# EAGLE schematic Teensy_Mother_Schematic (EAGLE 9.7.0)
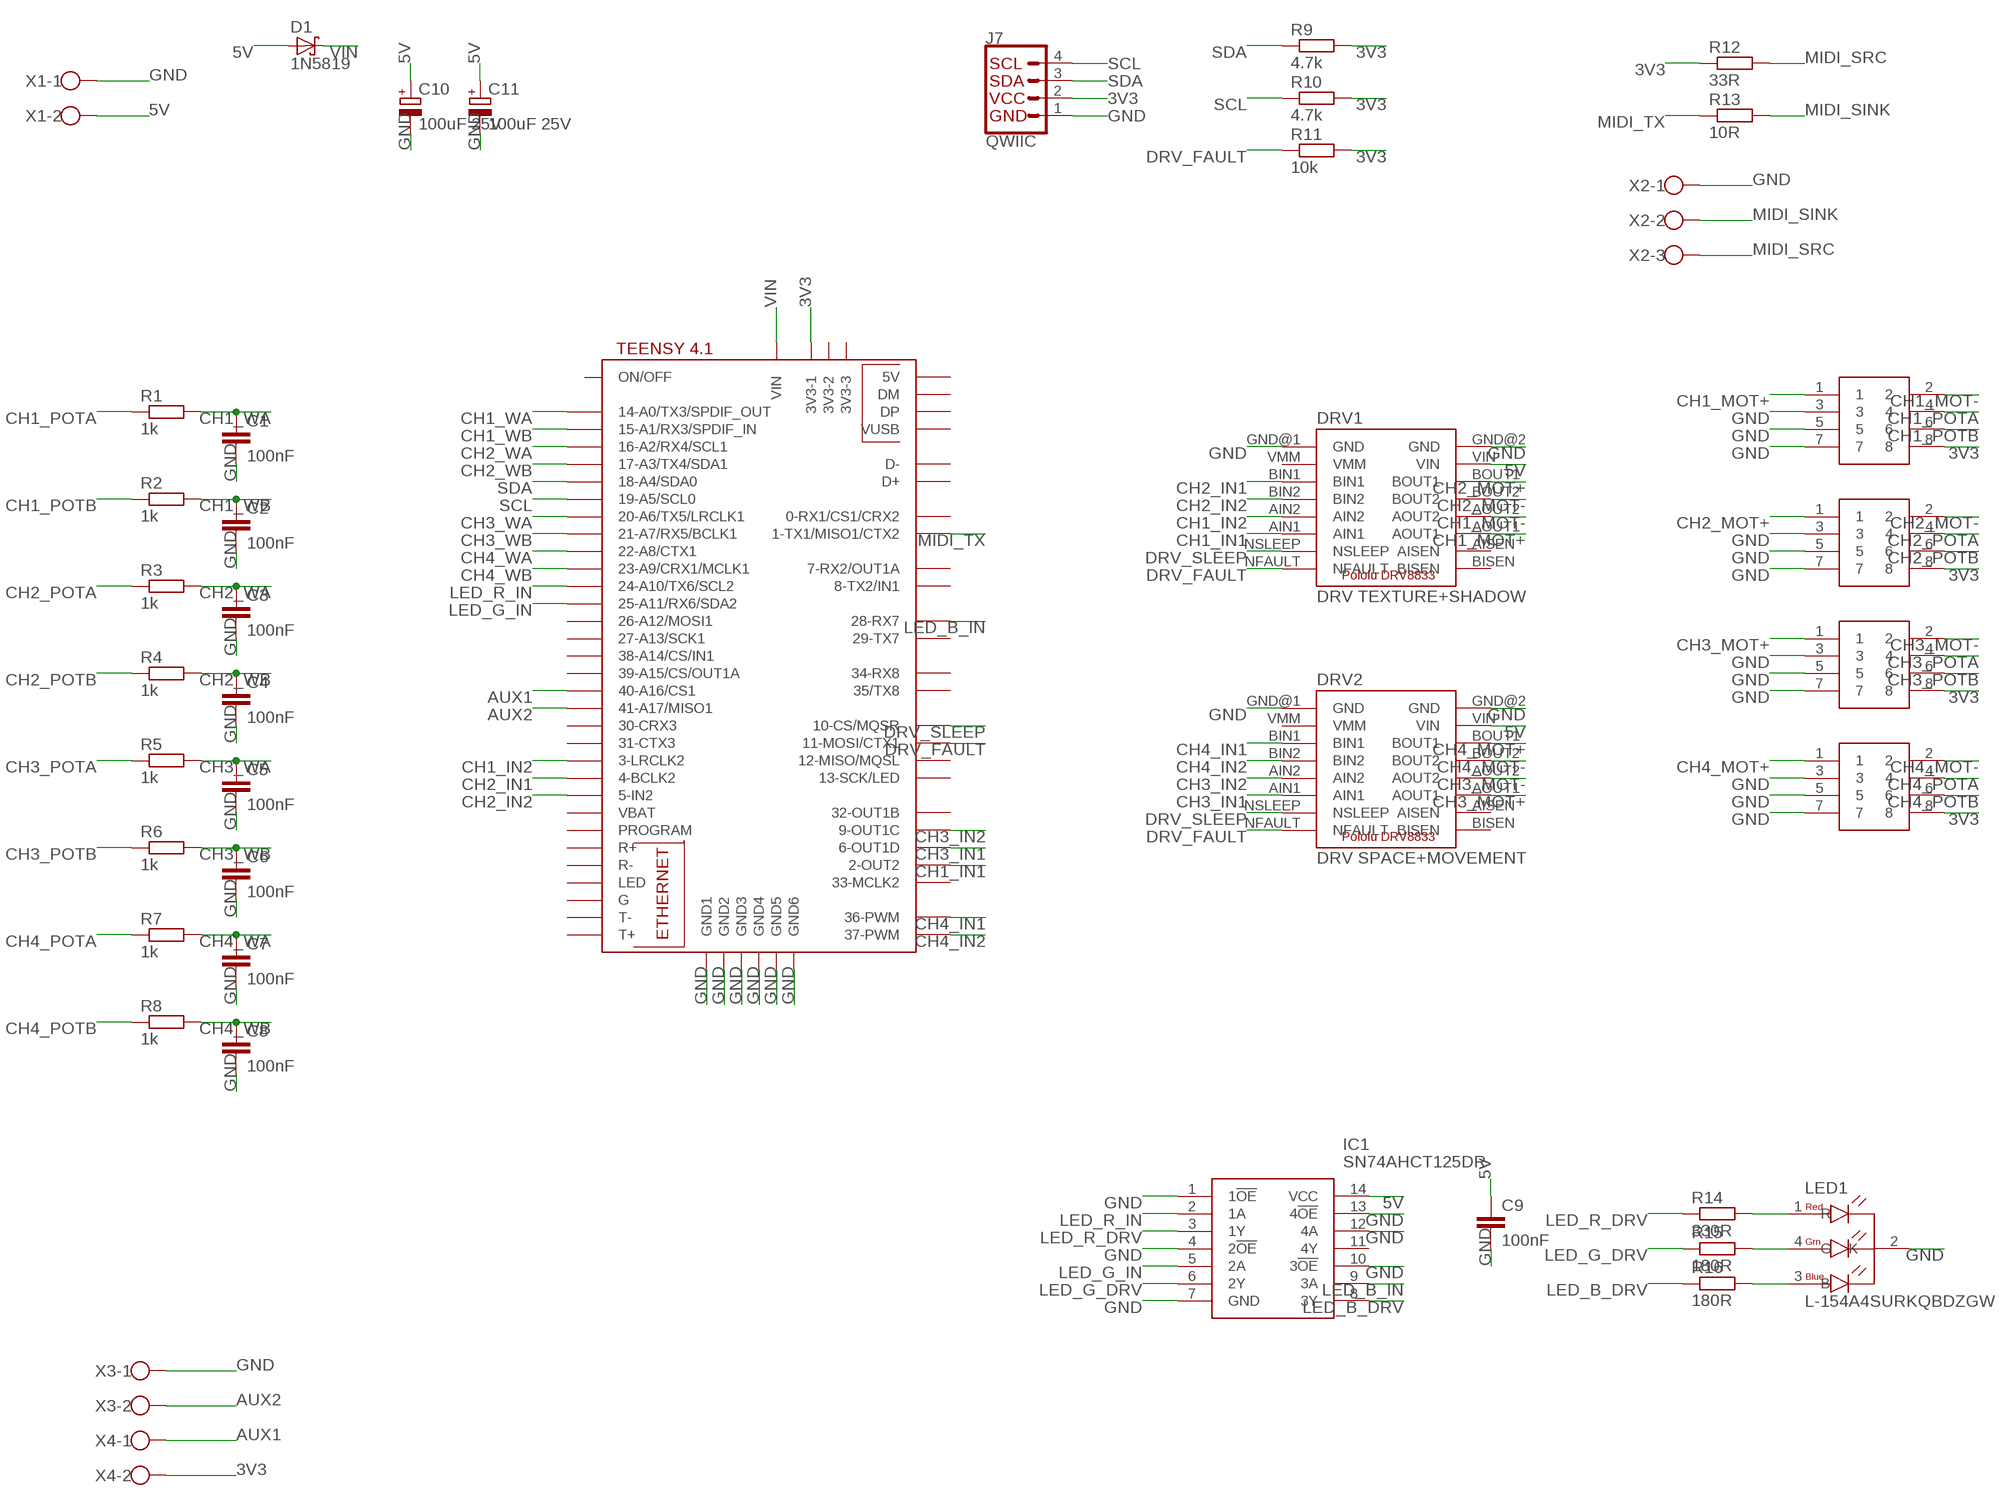
[diagram p0: schematic, sheet 1]

## Parts
C1  100nF  C-EU050-025X075  [C050-025X075]
C2  100nF  C-EU050-025X075  [C050-025X075]
C3  100nF  C-EU050-025X075  [C050-025X075]
C4  100nF  C-EU050-025X075  [C050-025X075]
C5  100nF  C-EU050-025X075  [C050-025X075]
C6  100nF  C-EU050-025X075  [C050-025X075]
C7  100nF  C-EU050-025X075  [C050-025X075]
C8  100nF  C-EU050-025X075  [C050-025X075]
C9  100nF  C-EU050-025X075  [C050-025X075]
C10  100uF 25V  CPOL-EUE3.5-8  [E3,5-8]
C11  100uF 25V  CPOL-EUE3.5-8  [E3,5-8]
D1  1N5819  SCHOTTKY-DIODEDO41  [DO41-10]
DRV1  DRV TEXTURE+SHADOW  POLOLU_DRV8833_2130  [POLOLU_2130_FH]
DRV2  DRV SPACE+MOVEMENT  POLOLU_DRV8833_2130  [POLOLU_2130_FH]
IC1  SN74AHCT125DR  [SOIC127P600X175-14N]
J1  SHADOW  IDC_2X4  [BOXHDR_2X4_V]
J2  TEXTURE  IDC_2X4  [BOXHDR_2X4_V]
J3  MOVEMENT  IDC_2X4  [BOXHDR_2X4_V]
J4  SPACE  IDC_2X4  [BOXHDR_2X4_V]
J7  QWIIC  I2C_STANDARD  [1X04]
LED1  L-154A4SURKQBDZGW  [LED5MM_RGB_4L_STAGGER]
R1  1k  R-EU_0204/7  [0204/7]
R2  1k  R-EU_0204/7  [0204/7]
R3  1k  R-EU_0204/7  [0204/7]
R4  1k  R-EU_0204/7  [0204/7]
R5  1k  R-EU_0204/7  [0204/7]
R6  1k  R-EU_0204/7  [0204/7]
R7  1k  R-EU_0204/7  [0204/7]
R8  1k  R-EU_0204/7  [0204/7]
R9  4.7k  R-EU_0204/7  [0204/7]
R10  4.7k  R-EU_0204/7  [0204/7]
R11  10k  R-EU_0204/7  [0204/7]
R12  33R  R-EU_0204/7  [0204/7]
R13  10R  R-EU_0204/7  [0204/7]
R14  330R  R-EU_0204/7  [0204/7]
R15  180R  R-EU_0204/7  [0204/7]
R16  180R  R-EU_0204/7  [0204/7]
U$1  TEENSY41  [TEENSY41]
X1  W237-1023D  [W237-102]
X2  W237-103  [W237-103]
X3  W237-1023D  [W237-102]
X4  W237-1023D  [W237-102]

## Nets
3V3 [SUPPLY]: J1.8 J2.8 J3.8 J4.8 J7.2 R9.2 R10.2 R11.2 R12.1 U$1.3V3-1 X4.2
5V [POWER]: C9.1 C10.+ C11.+ D1.A DRV1.VIN DRV2.VIN IC1.14(VCC) X1.2
AUX1: U$1.40-A16/CS1 X4.1
AUX2: U$1.41-A17/MISO1 X3.2
CH1_IN1: DRV1.AIN1 U$1.2-OUT2
CH1_IN2: DRV1.AIN2 U$1.3-LRCLK2
CH1_MOT+ [MOTOR]: DRV1.AOUT1 J1.1
CH1_MOT- [MOTOR]: DRV1.AOUT2 J1.2
CH1_POTA: J1.4 R1.1
CH1_POTB: J1.6 R2.1
CH1_WA: C1.1 R1.2 U$1.14-A0/TX3/SPDIF_OUT
CH1_WB: C2.1 R2.2 U$1.15-A1/RX3/SPDIF_IN
CH2_IN1: DRV1.BIN1 U$1.4-BCLK2
CH2_IN2: DRV1.BIN2 U$1.5-IN2
CH2_MOT+ [MOTOR]: DRV1.BOUT1 J2.1
CH2_MOT- [MOTOR]: DRV1.BOUT2 J2.2
CH2_POTA: J2.4 R3.1
CH2_POTB: J2.6 R4.1
CH2_WA: C3.1 R3.2 U$1.16-A2/RX4/SCL1
CH2_WB: C4.1 R4.2 U$1.17-A3/TX4/SDA1
CH3_IN1: DRV2.AIN1 U$1.6-OUT1D
CH3_IN2: DRV2.AIN2 U$1.9-OUT1C
CH3_MOT+ [MOTOR]: DRV2.AOUT1 J3.1
CH3_MOT- [MOTOR]: DRV2.AOUT2 J3.2
CH3_POTA: J3.4 R5.1
CH3_POTB: J3.6 R6.1
CH3_WA: C5.1 R5.2 U$1.20-A6/TX5/LRCLK1
CH3_WB: C6.1 R6.2 U$1.21-A7/RX5/BCLK1
CH4_IN1: DRV2.BIN1 U$1.36-PWM
CH4_IN2: DRV2.BIN2 U$1.37-PWM
CH4_MOT+ [MOTOR]: DRV2.BOUT1 J4.1
CH4_MOT- [MOTOR]: DRV2.BOUT2 J4.2
CH4_POTA: J4.4 R7.1
CH4_POTB: J4.6 R8.1
CH4_WA: C7.1 R7.2 U$1.22-A8/CTX1
CH4_WB: C8.1 R8.2 U$1.23-A9/CRX1/MCLK1
DRV_FAULT: DRV1.NFAULT DRV2.NFAULT R11.1 U$1.11-MOSI/CTX1
DRV_SLEEP: DRV1.NSLEEP DRV2.NSLEEP U$1.10-CS\MQSR(10-CS/MQSR)
GND [SUPPLY]: C1.2 C2.2 C3.2 C4.2 C5.2 C6.2 C7.2 C8.2 C9.2 C10.- C11.- DRV1.GND@1(GND) DRV1.GND@2(GND) DRV2.GND@1(GND) DRV2.GND@2(GND) IC1.1(1!OE) IC1.4(2!OE) IC1.7(GND) IC1.10(3!OE) IC1.12(4A) IC1.13(4!OE) J1.3 J1.5 J1.7 J2.3 J2.5 J2.7 J3.3 J3.5 J3.7 J4.3 J4.5 J4.7 J7.1 LED1.2(K) U$1.GND1 U$1.GND2 U$1.GND3 U$1.GND4 U$1.GND5 U$1.GND6 X1.1 X2.1 X3.1
LED_B: LED1.3(B) R16.2
LED_B_DRV: IC1.8(3Y) R16.1
LED_B_IN: IC1.9(3A) U$1.28-RX7
LED_G: LED1.4(G) R15.2
LED_G_DRV: IC1.6(2Y) R15.1
LED_G_IN: IC1.5(2A) U$1.25-A11/RX6/SDA2
LED_R: LED1.1(R) R14.2
LED_R_DRV: IC1.3(1Y) R14.1
LED_R_IN: IC1.2(1A) U$1.24-A10/TX6/SCL2
MIDI_SINK: R13.2 X2.2
MIDI_SRC: R12.2 X2.3
MIDI_TX: R13.1 U$1.1-TX1/MISO1/CTX2
SCL: J7.4 R10.1 U$1.19-A5/SCL0
SDA: J7.3 R9.1 U$1.18-A4/SDA0
VIN [POWER]: D1.C U$1.VIN
Unconnected: DRV1.AISEN DRV1.BISEN DRV1.VMM DRV2.AISEN DRV2.BISEN DRV2.VMM IC1.11(4Y) U$1.0-RX1/CS1/CRX2 U$1.3V3-2 U$1.3V3-3 U$1.7-RX2/OUT1A U$1.8-TX2/IN1 U$1.12-MISO/MQSL U$1.13-SCK/LED U$1.26-A12/MOSI1 U$1.27-A13/SCK1 U$1.29-TX7 U$1.30-CRX3 U$1.31-CTX3 U$1.32-OUT1B U$1.33-MCLK2 U$1.34-RX8 U$1.35-TX8(35/TX8) U$1.38-A14/CS/IN1 U$1.39-A15/CS/OUT1A U$1.+5V(5V) U$1.D+ U$1.D- U$1.DM U$1.DP U$1.G U$1.LED U$1.ON/OFF U$1.PROGRAM U$1.R+ U$1.R- U$1.T+ U$1.T- U$1.VBAT U$1.VUSB

## Library data of the parts
C1-C9 = rcl:C-EU: CAPACITOR, European symbol; SPICEPREFIX: C
C10 C11 = rcl:CPOL-EU: POLARIZED CAPACITOR, European symbol; SPICEPREFIX: C
D1 = adafruit lib:SCHOTTKY-DIODE: Schottky Diode
DRV1 DRV2 = Pololu_DRV8833_2130:POLOLU_DRV8833_2130: Pololu 2130 DRV8833 dual motor driver carrier on female headers. VIN 2.7-10.8 V, 1.2 A/ch, nSLEEP pulled high on module, nFAULT open drain, AISEN/BISEN grounded on module.
IC1 = SN74AHCT125DR:SN74AHCT125DR: Quadruple Bus Buffer Gates With 3-State Outputs Source: Datasheet <http://www.ti.com/lit/gpn/sn74ahct125>; ARROW_PART_NUMBER: SN74AHCT125DR; ARROW_PRICE-STOCK: https://www.arrow.com/en/products/sn74ahct125dr/texas-instruments.html?utm_currency=USD&region=europe; DESCRIPTION: Quadruple Bus Buffer Gates With 3-State Outputs; HEIGHT: 1.75mm; MANUFACTURER_NAME: Texas Instruments; MANUFACTURER_PART_NUMBER: SN74AHCT125DR; MOUSER_PART_NUMBER: 595-SN74AHCT125DR; MOUSER_PRICE-STOCK: https://www.mouser.co.uk/ProductDetail/Texas-Instruments/SN74AHCT125DR?qs=B7lSdIxWQkm9VQkJOjfRaA%3D%3D
J1-J4 = Motorpot_custom:IDC_2X4
J7 = Qwiic4:I2C_STANDARD: SparkFun I2C Standard Pinout Header SparkFun has standardized on a pinout for all I2C based sensor breakouts. This pinout allows I2C boards to be plugged directly into the headers on Arduino Uno compatible boards, and to be daisy chained easily. Example SparkFun Products: SparkFun Atmospheric Sensor Breakout - BME280 <https://www.sparkfun.com/products/13676> SparkFun Altitude/Pressure Sensor Breakout - MPL3115A2 <https://www.sparkfun.com/products/11084> SparkFun TOF Range Finder Sensor - VL6180 <https://www.sparkfun.com/products/12785>
LED1 = Kingbright_L154A4_RGB_CC:L-154A4SURKQBDZGW: Kingbright 5 mm RGB LED, common cathode. VF @20 mA: red 1.95 V, blue 3.3 V, green 3.3 V (max 4.1).
R1-R16 = rcl:R-EU_: RESISTOR, European symbol; SPICEPREFIX: R
U$1 = teensy lib:TEENSY41
X1 X3 X4 = con-wago-500 terminal:W237-102: WAGO SCREW CLAMP
X2 = con-wago-500 terminal:W237-103: WAGO SCREW CLAMP; MPN: 237-103; OC_FARNELL: unknown; OC_NEWARK: 18M7116

## Net classes
0 default: width 0.25 mm, clearance 0.2 mm
1 POWER: width 0.8 mm, clearance 0.25 mm
2 MOTOR: width 0.6 mm, clearance 0.25 mm
3 SUPPLY: width 0.4 mm, clearance 0.2 mm